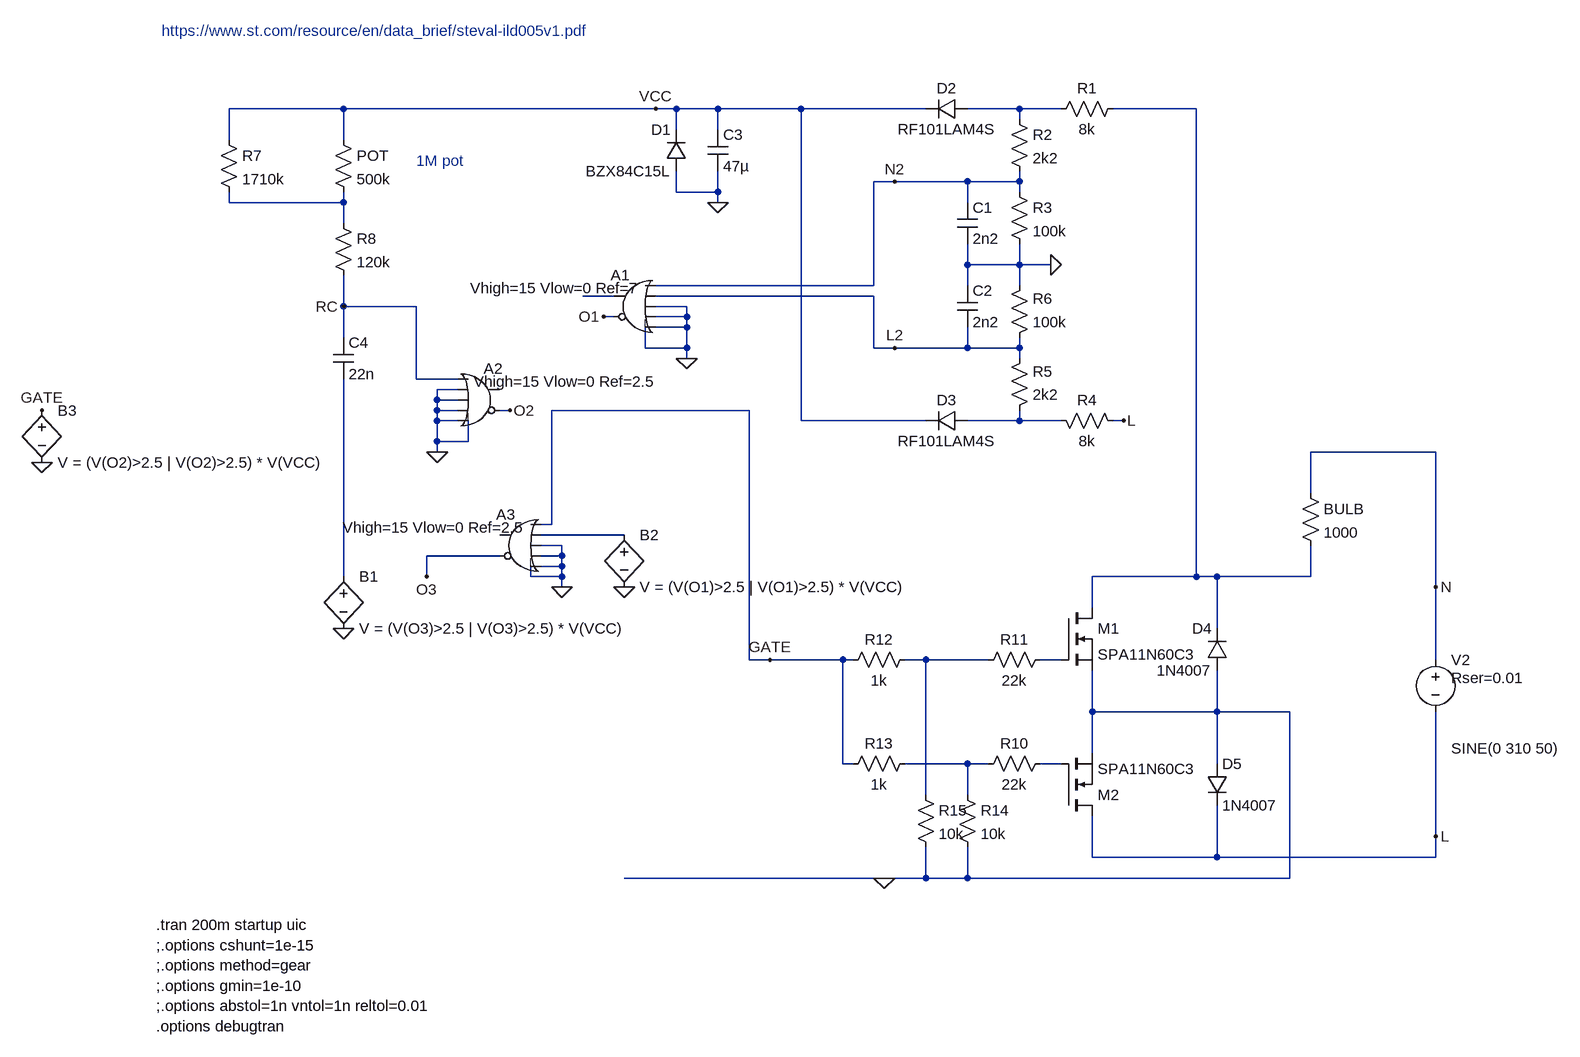
[diagram p0: schematic dimmer_trailing_edge_cd4025_NOR.asc]
dimmer_trailing_edge_cd4025_NOR.asc, the LTspice schematic file:
Version 4.1
SHEET 1 2448 1136
WIRE 560 -688 384 -688
WIRE 1040 -688 560 -688
WIRE 1072 -688 1040 -688
WIRE 1136 -688 1072 -688
WIRE 1264 -688 1136 -688
WIRE 1456 -688 1264 -688
WIRE 1600 -688 1520 -688
WIRE 1664 -688 1600 -688
WIRE 1872 -688 1744 -688
WIRE 1600 -672 1600 -688
WIRE 1072 -656 1072 -688
WIRE 1136 -656 1136 -688
WIRE 384 -640 384 -688
WIRE 560 -640 560 -688
WIRE 1408 -576 1376 -576
WIRE 1520 -576 1408 -576
WIRE 1600 -576 1600 -592
WIRE 1600 -576 1520 -576
WIRE 1072 -560 1072 -592
WIRE 1136 -560 1136 -592
WIRE 1136 -560 1072 -560
WIRE 1600 -560 1600 -576
WIRE 384 -544 384 -560
WIRE 560 -544 560 -560
WIRE 560 -544 384 -544
WIRE 1136 -544 1136 -560
WIRE 1520 -544 1520 -576
WIRE 560 -512 560 -544
WIRE 1520 -448 1520 -480
WIRE 1600 -448 1600 -480
WIRE 1600 -448 1520 -448
WIRE 1648 -448 1600 -448
WIRE 1376 -416 1376 -576
WIRE 1376 -416 1040 -416
WIRE 1520 -416 1520 -448
WIRE 1600 -416 1600 -448
WIRE 976 -400 928 -400
WIRE 1376 -400 1040 -400
WIRE 560 -384 560 -432
WIRE 672 -384 560 -384
WIRE 1088 -384 1040 -384
WIRE 976 -368 960 -368
WIRE 1088 -368 1088 -384
WIRE 1088 -368 1040 -368
WIRE 1088 -352 1088 -368
WIRE 1088 -352 1040 -352
WIRE 560 -336 560 -384
WIRE 1024 -320 1024 -352
WIRE 1088 -320 1088 -352
WIRE 1088 -320 1024 -320
WIRE 1376 -320 1376 -400
WIRE 1408 -320 1376 -320
WIRE 1520 -320 1520 -352
WIRE 1520 -320 1408 -320
WIRE 1600 -320 1600 -336
WIRE 1600 -320 1520 -320
WIRE 1088 -304 1088 -320
WIRE 1600 -304 1600 -320
WIRE 672 -272 672 -384
WIRE 736 -272 672 -272
WIRE 736 -256 704 -256
WIRE 704 -240 704 -256
WIRE 736 -240 704 -240
WIRE 704 -224 704 -240
WIRE 736 -224 704 -224
WIRE 816 -224 800 -224
WIRE 1184 -224 880 -224
WIRE 704 -208 704 -224
WIRE 736 -208 704 -208
WIRE 1264 -208 1264 -688
WIRE 1456 -208 1264 -208
WIRE 1600 -208 1600 -224
WIRE 1600 -208 1520 -208
WIRE 1664 -208 1600 -208
WIRE 1760 -208 1744 -208
WIRE 704 -176 704 -208
WIRE 752 -176 752 -208
WIRE 752 -176 704 -176
WIRE 704 -160 704 -176
WIRE 2240 -160 2048 -160
WIRE 2048 -96 2048 -160
WIRE 880 -48 880 -224
WIRE 880 -48 864 -48
WIRE 992 -32 864 -32
WIRE 896 -16 864 -16
WIRE 800 0 688 0
WIRE 896 0 896 -16
WIRE 896 0 864 0
WIRE 896 16 896 0
WIRE 896 16 864 16
WIRE 560 32 560 -272
WIRE 688 32 688 0
WIRE 848 32 848 16
WIRE 896 32 896 16
WIRE 896 32 848 32
WIRE 1872 32 1872 -688
WIRE 1872 32 1712 32
WIRE 1904 32 1872 32
WIRE 2048 32 2048 -16
WIRE 2048 32 1904 32
WIRE 896 48 896 32
WIRE 2240 48 2240 -160
WIRE 1712 80 1712 32
WIRE 1904 112 1904 32
WIRE 1184 160 1184 -224
WIRE 1216 160 1184 160
WIRE 1328 160 1216 160
WIRE 1344 160 1328 160
WIRE 1456 160 1424 160
WIRE 1552 160 1456 160
WIRE 1664 160 1632 160
WIRE 2240 160 2240 48
WIRE 1712 240 1712 176
WIRE 1904 240 1904 176
WIRE 1904 240 1712 240
WIRE 2016 240 1904 240
WIRE 1712 304 1712 240
WIRE 1328 320 1328 160
WIRE 1344 320 1328 320
WIRE 1520 320 1424 320
WIRE 1552 320 1520 320
WIRE 1664 320 1632 320
WIRE 1904 320 1904 240
WIRE 1456 368 1456 160
WIRE 1520 368 1520 320
WIRE 2240 432 2240 240
WIRE 1712 464 1712 400
WIRE 1904 464 1904 384
WIRE 1904 464 1712 464
WIRE 2240 464 2240 432
WIRE 2240 464 1904 464
WIRE 1392 496 992 496
WIRE 1456 496 1456 448
WIRE 1456 496 1392 496
WIRE 1520 496 1520 448
WIRE 1520 496 1456 496
WIRE 2016 496 2016 240
WIRE 2016 496 1520 496
FLAG 2240 48 N
FLAG 2240 432 L
FLAG 1216 160 GATE
FLAG 1136 -544 0
FLAG 1040 -688 VCC
FLAG 1392 496 0
FLAG 1648 -448 0
FLAG 1760 -208 L
FLAG 1088 -304 0
FLAG 560 -384 RC
FLAG 704 -160 0
FLAG 896 48 0
FLAG 560 112 0
FLAG 688 32 O3
FLAG 816 -224 O2
FLAG 960 -368 O1
FLAG 992 48 0
FLAG 96 -144 0
FLAG 96 -224 GATE
FLAG 1408 -320 L2
FLAG 1408 -576 N2
SYMBOL nmos 1664 80 R0
SYMATTR InstName M1
SYMATTR Value SPA11N60C3
SYMBOL nmos 1664 400 M180
SYMATTR InstName M2
SYMATTR Value SPA11N60C3
SYMBOL voltage 2240 144 R0
WINDOW 3 24 152 Left 2
WINDOW 123 24 124 Left 2
WINDOW 39 24 44 Left 2
SYMATTR Value SINE(0 310 50)
SYMATTR SpiceLine Rser=0.01
SYMATTR InstName V2
SYMBOL res 2032 -112 R0
SYMATTR InstName BULB
SYMATTR Value 1000
SYMBOL cap 1120 -656 R0
SYMATTR InstName C3
SYMATTR Value 47µ
SYMBOL res 1648 304 R90
WINDOW 0 0 56 VBottom 2
WINDOW 3 32 56 VTop 2
SYMATTR InstName R10
SYMATTR Value 22k
SYMBOL res 1648 144 R90
WINDOW 0 0 56 VBottom 2
WINDOW 3 32 56 VTop 2
SYMATTR InstName R11
SYMATTR Value 22k
SYMBOL res 1440 144 R90
WINDOW 0 0 56 VBottom 2
WINDOW 3 32 56 VTop 2
SYMATTR InstName R12
SYMATTR Value 1k
SYMBOL res 1440 304 R90
WINDOW 0 0 56 VBottom 2
WINDOW 3 32 56 VTop 2
SYMATTR InstName R13
SYMATTR Value 1k
SYMBOL res 1504 352 R0
SYMATTR InstName R14
SYMATTR Value 10k
SYMBOL res 1440 352 R0
SYMATTR InstName R15
SYMATTR Value 10k
SYMBOL diode 1088 -592 R180
WINDOW 0 24 64 Left 2
WINDOW 3 24 0 Left 2
SYMATTR InstName D1
SYMATTR Value BZX84C15L
SYMBOL diode 1520 -704 R90
WINDOW 0 0 32 VBottom 2
WINDOW 3 32 32 VTop 2
SYMATTR InstName D2
SYMATTR Value RF101LAM4S
SYMBOL res 1760 -704 R90
WINDOW 0 0 56 VBottom 2
WINDOW 3 32 56 VTop 2
SYMATTR InstName R1
SYMATTR Value 8k
SYMBOL res 1584 -688 R0
SYMATTR InstName R2
SYMATTR Value 2k2
SYMBOL res 1584 -576 R0
SYMATTR InstName R3
SYMATTR Value 100k
SYMBOL cap 1504 -544 R0
SYMATTR InstName C1
SYMATTR Value 2n2
SYMBOL diode 1520 -192 M270
WINDOW 0 32 32 VTop 2
WINDOW 3 0 32 VBottom 2
SYMATTR InstName D3
SYMATTR Value RF101LAM4S
SYMBOL res 1760 -192 M270
WINDOW 0 32 56 VTop 2
WINDOW 3 0 56 VBottom 2
SYMATTR InstName R4
SYMATTR Value 8k
SYMBOL res 1584 -208 M180
WINDOW 0 36 76 Left 2
WINDOW 3 36 40 Left 2
SYMATTR InstName R5
SYMATTR Value 2k2
SYMBOL res 1584 -320 M180
WINDOW 0 36 76 Left 2
WINDOW 3 36 40 Left 2
SYMATTR InstName R6
SYMATTR Value 100k
SYMBOL cap 1504 -352 M180
WINDOW 0 24 56 Left 2
WINDOW 3 24 8 Left 2
SYMATTR InstName C2
SYMATTR Value 2n2
SYMBOL diode 1920 176 R180
WINDOW 0 24 64 Left 2
WINDOW 3 24 0 Left 2
SYMATTR InstName D4
SYMATTR Value 1N4007
SYMBOL diode 1888 320 R0
SYMATTR InstName D5
SYMATTR Value 1N4007
SYMBOL Digital\\or 1008 -448 M0
WINDOW 123 -8 36 Left 2
SYMATTR Value2 Vhigh=15 Vlow=0 Ref=7
SYMATTR InstName A1
SYMBOL Digital\\or 768 -304 R0
WINDOW 123 -8 36 Left 2
SYMATTR Value2 Vhigh=15 Vlow=0 Ref=2.5
SYMATTR InstName A2
SYMBOL Digital\\or 832 -80 M0
WINDOW 123 -8 36 Left 2
SYMATTR Value2 Vhigh=15 Vlow=0 Ref=2.5
SYMATTR InstName A3
SYMBOL res 544 -656 R0
SYMATTR InstName POT
SYMATTR Value 500k
SYMBOL res 368 -656 R0
SYMATTR InstName R7
SYMATTR Value 1710k
SYMBOL res 544 -528 R0
SYMATTR InstName R8
SYMATTR Value 120k
SYMBOL cap 544 -336 R0
SYMATTR InstName C4
SYMATTR Value 22n
SYMBOL bv 560 16 R0
SYMATTR InstName B1
SYMATTR Value V = (V(O3)>2.5 | V(O3)>2.5) * V(VCC)
SYMBOL bv 992 -48 R0
SYMATTR InstName B2
SYMATTR Value V = (V(O1)>2.5 | V(O1)>2.5) * V(VCC)
SYMBOL bv 96 -240 R0
SYMATTR InstName B3
SYMATTR Value V = (V(O2)>2.5 | V(O2)>2.5) * V(VCC)
TEXT 280 -808 Left 2 ;https://www.st.com/resource/en/data_brief/steval-ild005v1.pdf
TEXT 272 568 Left 2 !.tran 200m startup uic\n;.options cshunt=1e-15\n;.options method=gear\n;.options gmin=1e-10\n;.options abstol=1n vntol=1n reltol=0.01\n.options debugtran
TEXT 672 -608 Left 2 ;1M pot

The netlist it stands for:
* dimmer_trailing_edge_cd4025_NOR.asc
M1 N002 N009 0 0 SPA11N60C3
M2 L N011 0 0 SPA11N60C3
V2 N L SINE(0 310 50) Rser=0.01
R§BULB N N002 1000
C3 VCC 0 47µ
R10 N011 N010 22k
R11 N009 N008 22k
R12 N008 GATE 1k
R13 N010 GATE 1k
R14 N010 0 10k
R15 N008 0 10k
D1 0 VCC BZX84C15L
D2 N001 VCC RF101LAM4S
R1 N002 N001 8k
R2 N001 N2 2k2
R3 N2 0 100k
C1 N2 0 2n2
D3 N005 VCC RF101LAM4S
R4 L N005 8k
R5 N005 L2 2k2
R6 L2 0 100k
C2 L2 0 2n2
D4 0 N002 1N4007
D5 0 L 1N4007
A1 N2 L2 0 0 0 O1 N004 0 OR Vhigh=15 Vlow=0 Ref=7
A2 RC 0 0 0 0 O2 0 0 OR Vhigh=15 Vlow=0 Ref=2.5
A3 GATE N006 0 0 0 O3 0 0 OR Vhigh=15 Vlow=0 Ref=2.5
R§POT VCC N003 500k
R7 VCC N003 1710k
R8 N003 RC 120k
C4 RC N007 22n
B1 N007 0 V = (V(O3)>2.5 | V(O3)>2.5) * V(VCC)
B2 N006 0 V = (V(O1)>2.5 | V(O1)>2.5) * V(VCC)
B3 GATE 0 V = (V(O2)>2.5 | V(O2)>2.5) * V(VCC)
.model D D
.lib standard.dio
.model NMOS NMOS
.model PMOS PMOS
.lib standard.mos
* https://www.st.com/resource/en/data_brief/steval-ild005v1.pdf
.tran 200m startup uic
;.options cshunt=1e-15
;.options method=gear
;.options gmin=1e-10
;.options abstol=1n vntol=1n reltol=0.01
.options debugtran
* 1M pot
.backanno
.end